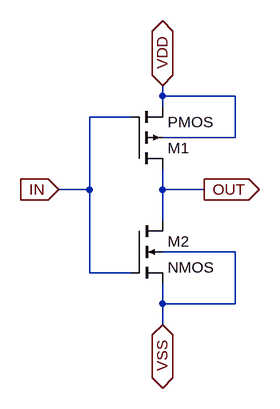
[diagram p0: schematic INVERTER.asc]
INVERTER.asc, the LTspice schematic file:
Version 4.1
SHEET 1 880 680
WIRE 240 -272 240 -288
WIRE 352 -272 240 -272
WIRE 240 -256 240 -272
WIRE 192 -240 128 -240
WIRE 352 -208 352 -272
WIRE 352 -208 240 -208
WIRE 128 -128 128 -240
WIRE 128 -128 80 -128
WIRE 240 -128 240 -160
WIRE 304 -128 240 -128
WIRE 240 -80 240 -128
WIRE 352 -32 240 -32
WIRE 128 0 128 -128
WIRE 192 0 128 0
WIRE 240 48 240 16
WIRE 352 48 352 -32
WIRE 352 48 240 48
WIRE 240 80 240 48
FLAG 240 -288 VDD
IOPIN 240 -288 BiDir
FLAG 80 -128 IN
IOPIN 80 -128 In
FLAG 304 -128 OUT
IOPIN 304 -128 Out
FLAG 240 80 VSS
IOPIN 240 80 BiDir
SYMBOL pmos4 192 -160 M180
SYMATTR InstName M1
SYMBOL nmos4 192 -80 R0
SYMATTR InstName M2

The netlist it stands for:
* INVERTER.asc
M1 OUT IN VDD VDD PMOS
M2 OUT IN VSS VSS NMOS
.model NMOS NMOS
.model PMOS PMOS
.lib standard.mos
.backanno
.end